# Altium schematic sheet ADC AIN.SchDoc: ADC Analogue Input Connections
size A4; ApprovedBy: LD Stanton; Author: LD Stanton; CompanyName: University of Cape Town; DrawnBy: Lawrence Stanton; Engineer: Lawrence Stanton; Organization: University of Cape Town; Address1: Department of Electrical Engineering; Address2: Rondebosch; Address3: Cape Town; Address4: South Africa 7701; DocumentNumber: 9; SheetNumber: 9; SheetTotal: 14
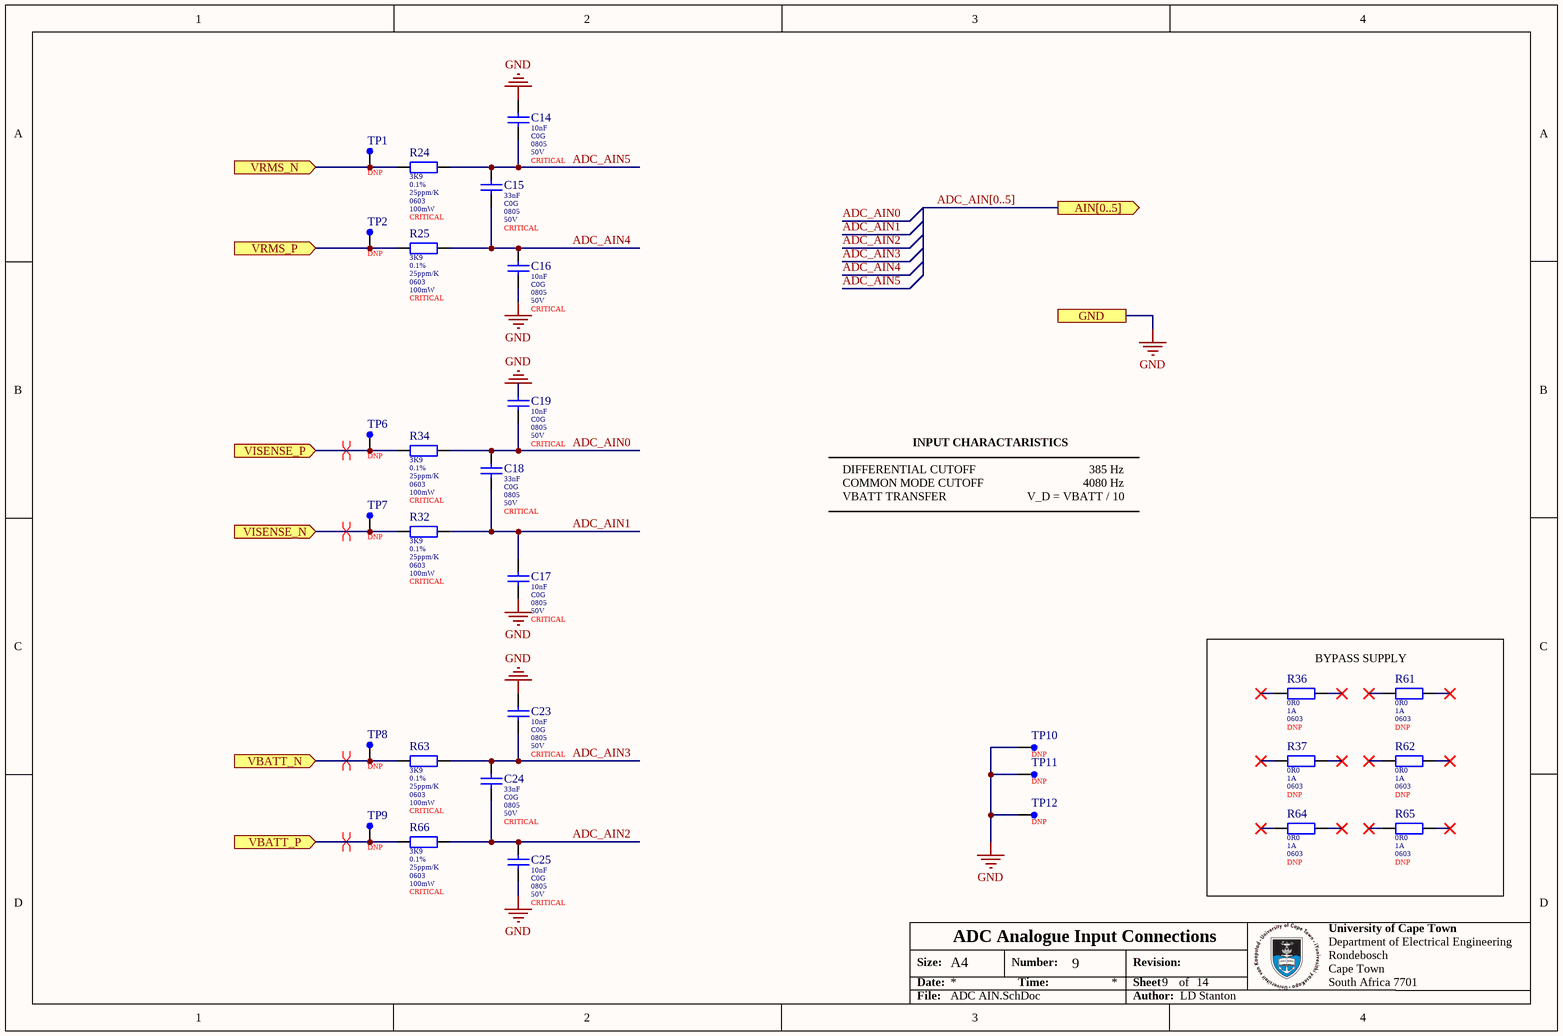
[diagram p0: ADC AIN.SchDoc]

## Parts
C14  value 10nF  Dielectric: C0G  Package: 0805  Voltage: 50V  Populate: CRITICAL  [0805 (Murata GRM) B]  (hidden comment: GRM2195C1H103FA01D)
C15  value 33nF  Dielectric: C0G  Package: 0805  Voltage: 50V  Populate: CRITICAL  [0805 (Murata GRM) B]  (hidden comment: GRM2165C1H333JA01D)
C16  value 10nF  Dielectric: C0G  Package: 0805  Voltage: 50V  Populate: CRITICAL  [0805 (Murata GRM) B]  (hidden comment: GRM2195C1H103FA01D)
C17  value 10nF  Dielectric: C0G  Package: 0805  Voltage: 50V  Populate: CRITICAL  [0805 (Murata GRM) B]  (hidden comment: GRM2195C1H103FA01D)
C18  value 33nF  Dielectric: C0G  Package: 0805  Voltage: 50V  Populate: CRITICAL  [0805 (Murata GRM) B]  (hidden comment: GRM2165C1H333JA01D)
C19  value 10nF  Dielectric: C0G  Package: 0805  Voltage: 50V  Populate: CRITICAL  [0805 (Murata GRM) B]  (hidden comment: GRM2195C1H103FA01D)
C23  value 10nF  Dielectric: C0G  Package: 0805  Voltage: 50V  Populate: CRITICAL  [0805 (Murata GRM) B]  (hidden comment: GRM2195C1H103FA01D)
C24  value 33nF  Dielectric: C0G  Package: 0805  Voltage: 50V  Populate: CRITICAL  [0805 (Murata GRM) B]  (hidden comment: GRM2165C1H333JA01D)
C25  value 10nF  Dielectric: C0G  Package: 0805  Voltage: 50V  Populate: CRITICAL  [0805 (Murata GRM) B]  (hidden comment: GRM2195C1H103FA01D)
R24  value 3K9  Tolerance: 0.1%  Temperature Coefficient: 25ppm/K  Package: 0603  Power: 100mW  Populate: CRITICAL  [0603 (Yageo RT) B]  (hidden comment: RT0603BRD073K9L)
R25  value 3K9  Tolerance: 0.1%  Temperature Coefficient: 25ppm/K  Package: 0603  Power: 100mW  Populate: CRITICAL  [0603 (Yageo RT) B]  (hidden comment: RT0603BRD073K9L)
R32  value 3K9  Tolerance: 0.1%  Temperature Coefficient: 25ppm/K  Package: 0603  Power: 100mW  Populate: CRITICAL  [0603 (Yageo RT) B]  (hidden comment: RT0603BRD073K9L)
R34  value 3K9  Tolerance: 0.1%  Temperature Coefficient: 25ppm/K  Package: 0603  Power: 100mW  Populate: CRITICAL  [0603 (Yageo RT) B]  (hidden comment: RT0603BRD073K9L)
R36  value 0R0  Current: 1A  Package: 0603  Populate: DNP  [0603 (Uniroyal) B]  (hidden comment: 0603WAF0000T5E)
R37  value 0R0  Current: 1A  Package: 0603  Populate: DNP  [0603 (Uniroyal) B]  (hidden comment: 0603WAF0000T5E)
R61  value 0R0  Current: 1A  Package: 0603  Populate: DNP  [0603 (Uniroyal) B]  (hidden comment: 0603WAF0000T5E)
R62  value 0R0  Current: 1A  Package: 0603  Populate: DNP  [0603 (Uniroyal) B]  (hidden comment: 0603WAF0000T5E)
R63  value 3K9  Tolerance: 0.1%  Temperature Coefficient: 25ppm/K  Package: 0603  Power: 100mW  Populate: CRITICAL  [0603 (Yageo RT) B]  (hidden comment: RT0603BRD073K9L)
R64  value 0R0  Current: 1A  Package: 0603  Populate: DNP  [0603 (Uniroyal) B]  (hidden comment: 0603WAF0000T5E)
R65  value 0R0  Current: 1A  Package: 0603  Populate: DNP  [0603 (Uniroyal) B]  (hidden comment: 0603WAF0000T5E)
R66  value 3K9  Tolerance: 0.1%  Temperature Coefficient: 25ppm/K  Package: 0603  Power: 100mW  Populate: CRITICAL  [0603 (Yageo RT) B]  (hidden comment: RT0603BRD073K9L)
TP1  Placement: DNP  [Test Point Keystone 5000]  (hidden comment: 5000)
TP2  Placement: DNP  [Test Point Keystone 5000]  (hidden comment: 5000)
TP6  Placement: DNP  [Test Point Keystone 5000]  (hidden comment: 5000)
TP7  Placement: DNP  [Test Point Keystone 5000]  (hidden comment: 5000)
TP8  Placement: DNP  [Test Point Keystone 5000]  (hidden comment: 5000)
TP9  Placement: DNP  [Test Point Keystone 5000]  (hidden comment: 5000)
TP10  Placement: DNP  [Test Point Keystone 5001]  (hidden comment: 5001)
TP11  Placement: DNP  [Test Point Keystone 5001]  (hidden comment: 5001)
TP12  Placement: DNP  [Test Point Keystone 5001]  (hidden comment: 5001)

## Blocks framed on the sheet
BYPASS SUPPLY: R36 R37 R61 R62 R64 R65

## Ports
AIN[0..5] (out), GND, VBATT_N (in), VBATT_P (in), VISENSE_N (in), VISENSE_P (in), VRMS_N (in), VRMS_P (in)

## Nets
GND: C14.2 C16.1 C17.2 C19.1 C23.2 C25.1 TP10.1 TP11.1 TP12.1 ; port GND
ADC_AIN0: C18.2 C19.2 R34.2
ADC_AIN1: C17.1 C18.1 R32.2
ADC_AIN2: C24.2 C25.2 R66.2
ADC_AIN3: C23.1 C24.1 R63.2
ADC_AIN4: C15.2 C16.2 R25.2
ADC_AIN5: C14.1 C15.1 R24.2
VBATT_N: R63.1 TP8.1 ; port VBATT_N
VBATT_P: R66.1 TP9.1 ; port VBATT_P
VISENSE_N: R32.1 TP7.1 ; port VISENSE_N
VISENSE_P: R34.1 TP6.1 ; port VISENSE_P
VRMS_N: R24.1 TP1.1 ; port VRMS_N
VRMS_P: R25.1 TP2.1 ; port VRMS_P

Not connected (* = marked no-connect by the designer): R36 1* 2*; R37 1* 2*; R61 1* 2*; R62 1* 2*; R64 1* 2*; R65 1* 2*

## Buses and harness runs
bus ADC_AIN[0..5] = port AIN[0..5]

## Layout directives
differential pair: VBATT_N, VBATT_P, VISENSE_N, VISENSE_P

## Notes on the sheet
- INPUT CHARACTARISTICS
- DIFFERENTIAL CUTOFF
- COMMON MODE CUTOFF
- VBATT TRANSFER
- 385 Hz
- 4080 Hz
- V_D = VBATT / 10
- Size:
- Date:
- A4
- Number:
- Time:
- Revision:
- Sheet
- of
- File:
- Author:

## Library data of the parts
C14 C16 C17 C19 C23 C25 = CMP-00129-1: MLCC 10nF 0805 50V C0G ±1%; Manufacturer: Murata; Tolerance: 1%; ComponentLink1Description: Catalogue; ComponentLink2Description: Product Page; ComponentLink2URL: https://www.murata.com/en-global/products/productdetail.aspx?partno=GRM2195C1H103JA01%23; ComponentLink3URL: https://search.murata.co.jp/Ceramy/image/img/A01X/G101/ENG/GRM2195C1H103JA01-01A.pdf; ComponentLink1URL: https://jlcpcb.com/api/file/downloadByFileSystemAccessId/8588936099087454208; ComponentLink3Description: Datasheet; LCSC Part Number: C441760; Max Operating Temperature: 125°C; Min Operating Temperature: -55°C
C15 C18 C24 = CMP-001-00005-1: MLCC 33nF 0805 50V C0G ±5%; Manufacturer: Murata; Max Operating Temperature: 125°C; ComponentLink3Description: Datasheet; LCSC Part Number: C1518212; ComponentLink2URL: https://www.murata.com/products/productdetail?partno=GRM2165C1H333JA01%23; Min Operating Temperature: -55°C; Tolerance: 5%; ComponentLink3URL: https://search.murata.co.jp/Ceramy/image/img/A01X/G101/ENG/GRM2165C1H333JA01-01A.pdf; ComponentLink1URL: https://jlcpcb.com/api/file/downloadByFileSystemAccessId/8588936099087454208; ComponentLink2Description: Product Page; ComponentLink1Description: Catalogue
R24 R25 R32 R34 R63 R66 = CMP-009-00003-1: Resistor 3K9 0603 ±0.1% Thin Film Yaego; Voltage Rating: 75V; Composition: Thin Film; Min Operating Temperature: -55°C; LCSC Part Number: C728592; ComponentLink1URL: https://jlcpcb.com/api/file/downloadByFileSystemAccessId/8588919467732840449; Max Operating Temperature: 155°C; Manufacturer: Yaego; ComponentLink1Description: Datasheet
R36 R37 R61 R62 R64 R65 = CMP-010-000359-7: Jumper 0603 1A Uniroyal; Pin Count: 2; ComponentLink1URL: https://datasheet.lcsc.com/szlcsc/1811062009_UNI-ROYAL-Uniroyal-Elec-0603WAF1002T5E_C25804.pdf; Manufacturer: Uniroyal; LCSC Part Number: C21189; Temperature: -55 - 155°C; ComponentLink1Description: Datasheet
TP1 TP2 TP6-TP9 = CMP-00140-2: Keystone Test Point Insulated Ring Red; LCSC Part Number: C5199900
TP10-TP12 = CMP-00028-00009-2: Keystone Test Point Insulated Ring Black; LCSC Part Number: C238122